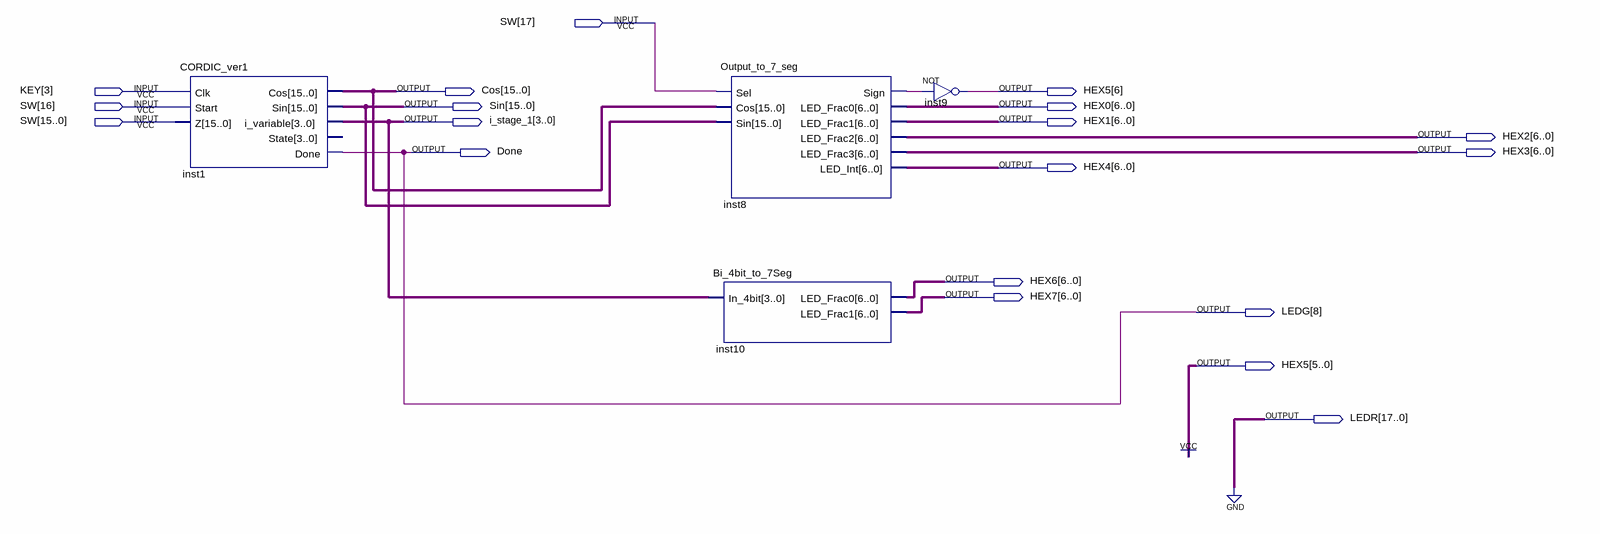
[diagram p0: schematic sheet]
// Quartus schematic CORDIC_ver1_KIT.bdf as structural Verilog: 4 symbols, 19 pins
module CORDIC_ver1_KIT (
  input  [17:0] SW,
  input  [3:3] KEY,
  output [15:0] Cos,
  output [6:0] HEX5,
  output [15:0] Sin,
  output [6:0] HEX0,
  output [3:0] i_stage_1,
  output [6:0] HEX1,
  output [6:0] HEX2,
  output Done,
  output [6:0] HEX3,
  output [6:0] HEX4,
  output [6:0] HEX6,
  output [6:0] HEX7,
  output [8:8] LEDG,
  output [17:0] LEDR
);

  wire inst8_sign;

  CORDIC_ver1 inst1 (
    .Clk(KEY[3]), .Start(SW[16]), .Z(SW[15:0]), .Cos(Cos), .Sin(Sin), .i_variable(i_stage_1), .Done(Done));  // open: State
  Output_to_7_seg inst8 (
    .Sel(SW[17]), .Cos(Cos), .Sin(Sin), .Sign(inst8_sign), .LED_Frac0(HEX0), .LED_Frac1(HEX1),
    .LED_Frac2(HEX2), .LED_Frac3(HEX3), .LED_Int(HEX4));
  Bi_4bit_to_7Seg inst10 (.In_4bit(i_stage_1), .LED_Frac0(HEX6), .LED_Frac1(HEX7));
  not inst9 (HEX5[6], inst8_sign);

  assign HEX5[5:0] = {6{1'b1}};
  assign LEDG[8] = Done;
  assign LEDR = {18{1'b0}};
endmodule
